# EasyEDA Pro project travellium-12v-desktop-power-supply-cc8d8467.epro, schematic EG1163S_P
Board Name: EG1163S_P; Create Date: 2024-08-01; Page Name: EG1163S_P_SCH; Project Name: 12V 30A 360W桌面DCDC电源; Schematic Name: EG1163S_P; Update Date: 2024-08-08; Company: 嘉立创EDA; Page Size: A4; Version: V1.0
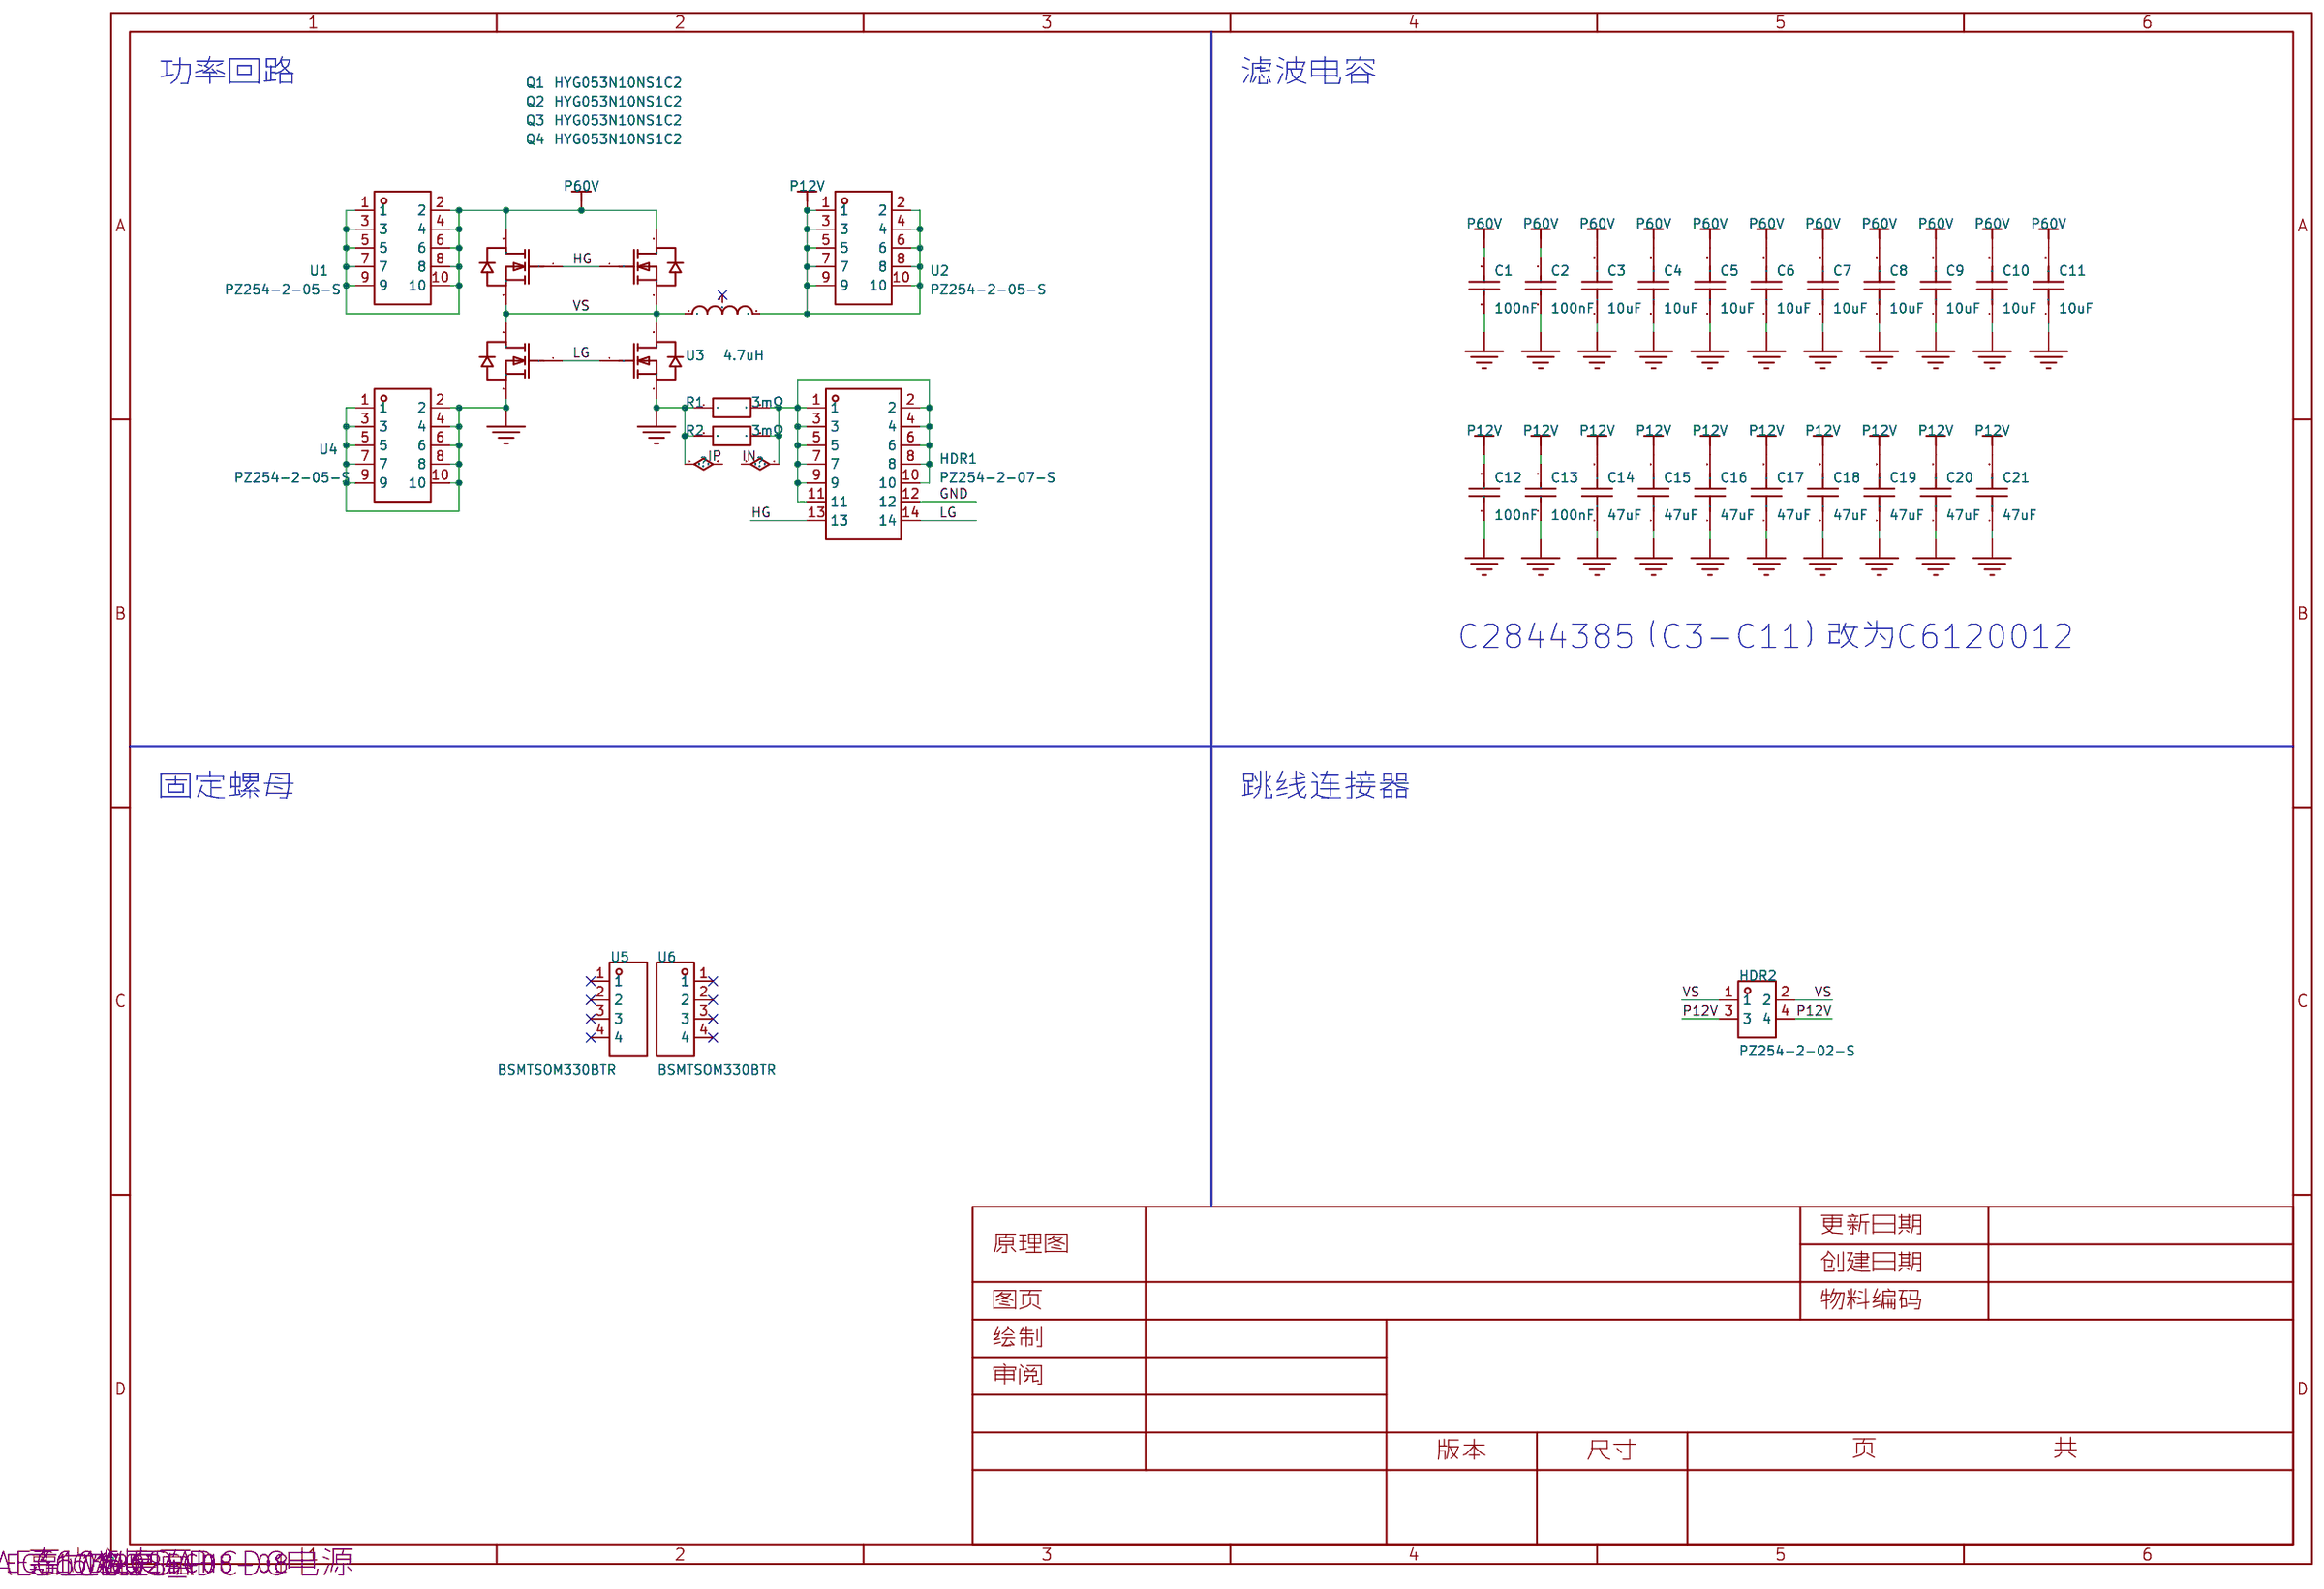
[diagram p2: schematic sheet]

## Parts
C1  100nF  [C1206]
C2  100nF  [C1206]
C3  10uF  [C1210]
C4  10uF  [C1210]
C5  10uF  [C1210]
C6  10uF  [C1210]
C7  10uF  [C1210]
C8  10uF  [C1210]
C9  10uF  [C1210]
C10  10uF  [C1210]
C11  10uF  [C1210]
C12  100nF  [C1206]
C13  100nF  [C1206]
C14  47uF  [C1206]
C15  47uF  [C1206]
C16  47uF  [C1206]
C17  47uF  [C1206]
C18  47uF  [C1206]
C19  47uF  [C1206]
C20  47uF  [C1206]
C21  47uF  [C1206]
HDR1  PZ254-2-07-S  [HDR-SMD_14P-P2.54-V-M-R2-C7-LS7.4]
HDR2  PZ254-2-02-S  [HDR-SMD_4P-P2.54-V-M-R2-C2-LS7.5]
Q1  HYG053N10NS1C2  [PDFN-8_L5.8-W5.0-P1.27-LS6.2-BL]
Q2  HYG053N10NS1C2  [PDFN-8_L5.8-W5.0-P1.27-LS6.2-BL]
Q3  HYG053N10NS1C2  [PDFN-8_L5.8-W5.0-P1.27-LS6.2-BL]
Q4  HYG053N10NS1C2  [PDFN-8_L5.8-W5.0-P1.27-LS6.2-BL]
R1  3mΩ  [R2512]
R2  3mΩ  [R2512]
U1  PZ254-2-05-S  [HDR-SMD_10P-P2.54-V-M-R2-C5-LS7.5]
U2  PZ254-2-05-S  [HDR-SMD_10P-P2.54-V-M-R2-C5-LS7.5]
U3  4.7uH  [IND-SMD_3P-L27.9-W19.7-P10.43-LS27.9-BL]
U4  PZ254-2-05-S  [HDR-SMD_10P-P2.54-V-M-R2-C5-LS7.5]
U5  BSMTSOM330BTR  [SMD_BD5.6-D4.1]
U6  BSMTSOM330BTR  [SMD_BD5.6-D4.1]

## Library data of the parts
C1 C2 C12 C13 = 1206B104K101NT: 容值:100nF;精度:±10%;额定电压:100V;材质(温度系数):X7R;; LCSC Part Name: 100nF ±10% 100V; Supplier Part: C110255; Manufacturer: FH(风华); Supplier Footprint: 1206; Datasheet: https://atta.szlcsc.com/upload/public/pdf/source/20200305/C486355_26A10D38EF8C2A5C37091D0039909270.pdf; Supplier: LCSC; Tolerance: ±10%; Voltage Rated: 100V; Temperature Coefficient: X7R
C3-C11 = C1210X7R106K101NT: 容值:10uF;精度:±10%;额定电压:100V;材质(温度系数):-;; LCSC Part Name: 10uF ±10% 100V; Supplier Part: C2844385; Manufacturer: SANYEAR(叁叶源); Supplier Footprint: 1210; Datasheet: https://atta.szlcsc.com/upload/public/pdf/source/20200102/C475251_1E30ECAC0E8AE7254982658A02A2D78C.pdf; Supplier: LCSC; Tolerance: ±10%; Voltage Rated: 100V
C14-C21 = CGA1210X5R106K630RT: 容值:47uF;精度:±20%;额定电压:25V;材质(温度系数):X5R;; Manufacturer: HRE(芯声); Supplier: LCSC; Supplier Part: C6120012; LCSC Part Name: 47uF ±20% 25V; Supplier Footprint: 1210; Tolerance: ±20%; Voltage Rated: 63V; Temperature Coefficient: X5R
HDR1 = PZ254-2-07-S: 插针结构:2x7P;间距:2.54mm;行距:2.54mm;圆针/方针:方针;安装类型:立贴;排数:双排;总PIN位数:14P;额定电流:3A;额定电压:250V;配合针长度:6mm;塑高:2.5mm;端接针长度:-;工作温度范围:-40℃~+105℃;焊接温度(最大值):260℃@5S;颜色:黑色;; LCSC Part Name: 2x7P 间距:2.54mm 方针 立贴 黑色; Supplier Part: C3294465; Manufacturer: HCTL(华灿天禄); Supplier Footprint: SMD,P=2.54mm; JLCPCB Part Class: 扩展库; Datasheet: https://atta.szlcsc.com/upload/public/pdf/source/20230609/FB2B5B924AA338E6CB93C3BD1D012B72.pdf; Supplier: LCSC; Pin Structure: 2x7P; Pitch: 2.54mm; Row Spacing: 2.54mm; Circluar Pins/Square Pins: 方针; Mounting Type: 立贴; Number of Rows: 双排; Number of Pins: 14P; Current Rating (Max): 3A; Voltage Rating (Max): 250V; Length of Mating Pin: 6mm; Insulation Height: 2.5mm; Operating Temperature Range: -40℃~+105℃; Soldering Temperature(Max): 260℃@5S; Color: 黑色
HDR2 = PZ254-2-02-S: 插针结构:2x2P;间距:2.54mm;行距:2.54mm;圆针/方针:方针;安装类型:立贴;排数:双排;总PIN位数:4P;额定电流:3A;额定电压:250V;配合针长度:6mm;塑高:2.5mm;端接针长度:-;工作温度范围:-40℃~+105℃;焊接温度(最大值):260℃@5S;颜色:黑色;; LCSC Part Name: 2x2P 间距:2.54mm 方针 立贴 黑色; Supplier Part: C3294460; Manufacturer: HCTL(华灿天禄); Supplier Footprint: SMD,P=2.54mm; Datasheet: https://atta.szlcsc.com/upload/public/pdf/source/20230609/FB2B5B924AA338E6CB93C3BD1D012B72.pdf; Supplier: LCSC; Pin Structure: 2x2P; Pitch: 2.54mm; Row Spacing: 2.54mm; Circluar Pins/Square Pins: 方针; Mounting Type: 立贴; Number of Rows: 双排; Number of Pins: 4P; Current Rating (Max): 3A; Voltage Rating (Max): 250V; Length of Mating Pin: 6mm; Insulation Height: 2.5mm; Operating Temperature Range: -40℃~+105℃; Soldering Temperature(Max): 260℃@5S; Color: 黑色
Q1-Q4 = HYG053N10NS1C2: 类型:N沟道;漏源电压(Vdss):100V;连续漏极电流(Id):95A;功率(Pd):83.3W;导通电阻(RDS(on)@Vgs,Id):4.6mΩ@10V,20A;阈值电压(Vgs(th)@Id):3V@250uA;; LCSC Part Name: N沟道 耐压:100V 电流:95A; Supplier Part: C2986239; Manufacturer: HUAYI(华羿微); Supplier Footprint: PDFN-8(5x5.8); Datasheet: https://atta.szlcsc.com/upload/public/pdf/source/20220330/BC0DD90DBB312B6AF0309CF1F3408B77.pdf; Supplier: LCSC; Type: N沟道; Drain Source Voltage (Vdss): 100V; Continuous Drain Current (Id): 95A; Power Dissipation (Pd): 83.3W; Drain Source On Resistance (RDS(on)@Vgs,Id): 4.6mΩ@10V,20A; Gate Threshold Voltage (Vgs(th)@Id): 3V@250uA; Total Gate Charge (Qg@Vgs): 73nC@10V; Input Capacitance (Ciss@Vds): 3.744nF@25V; Reverse Transfer Capacitance (Crss@Vds): 153pF@25V; Operating Temperature: -55℃~+175℃@(Tj)
R1 R2 = LR2512D-3W-3mR-1%: 电阻类型:采样电阻;阻值:3mΩ;精度:±1%;功率:3W;温度系数:25ppm/℃~+50ppm/℃;安装方式:贴片;; LCSC Part Name: 3mΩ ±1% 3W; Supplier Part: C500737; Manufacturer: Milliohm(毫欧); Supplier Footprint: 2512; Datasheet: https://atta.szlcsc.com/upload/public/pdf/source/20211008/27BCB003066C6550DC06C87D8395239C.pdf; Supplier: LCSC; Type: 采样电阻; Tolerance: ±1%; Power(Watts): 3W; Temperature Coefficient: 25ppm/℃~+50ppm/℃; Mounting Sytle: 贴片
U1 U2 U4 = PZ254-2-05-S: 插针结构:2x5P;间距:2.54mm;行距:2.54mm;圆针/方针:方针;安装类型:立贴;排数:双排;总PIN位数:10P;额定电流:3A;额定电压:250V;配合针长度:6mm;塑高:2.5mm;端接针长度:-;工作温度范围:-40℃~+105℃;焊接温度(最大值):260℃@5S;颜色:黑色;; LCSC Part Name: 2x5P 间距:2.54mm 方针 立贴 黑色; Supplier Part: C3294463; Manufacturer: HCTL(华灿天禄); Supplier Footprint: SMD,P=2.54mm; Datasheet: https://atta.szlcsc.com/upload/public/pdf/source/20230609/FB2B5B924AA338E6CB93C3BD1D012B72.pdf; Supplier: LCSC; Pin Structure: 2x5P; Pitch: 2.54mm; Row Spacing: 2.54mm; Circluar Pins/Square Pins: 方针; Mounting Type: 立贴; Number of Rows: 双排; Number of Pins: 10P; Current Rating (Max): 3A; Voltage Rating (Max): 250V; Length of Mating Pin: 6mm; Insulation Height: 2.5mm; Operating Temperature Range: -40℃~+105℃; Soldering Temperature(Max): 260℃@5S; Color: 黑色
U3 = FC-SE2915-4R7M: 电感值:4.7uH;精度:±20%;额定电流:32A;饱和电流(Isat):50.1A;; Manufacturer: FC(方成); Supplier: LCSC; Supplier Part: C7466125; LCSC Part Name: 4.7uH ±20% 50.1A; Supplier Footprint: SMD; Datasheet: https://atta.szlcsc.com/upload/public/pdf/source/20230712/96DF22DB850A53D8EF9E65329083AA7B.pdf; Tolerance: ±20%; Rated Current: 32A; Saturation Current (Isat): 50.1A
U5 U6 = BSMTSOM330BTR: 圆螺母 公称直径:M3 螺距:0.5mm 整体厚度:453mm L3材料:铜表面处理:镀锡 铜镀锡; LCSC Part Name: M3螺母 3MM M3x5.56xL3+1.53 BSMTSOM330BTR 铜镀锡; Supplier Part: C20617225; Manufacturer: DGBZ(东莞博众); Datasheet: https://atta.szlcsc.com/upload/public/pdf/source/20240129/9302AE24E0C0BB9358D3C074F5529EEE.pdf; Supplier: LCSC; specifications: M3x3; surface treatment: 铜镀锡; Product Description: M3x5.56xL3+1.53; length: 3MM

## Nets
GND: C1.1 C2.1 C3.1 C4.1 C5.1 C6.1 C7.1 C8.1 C9.1 C10.1 C11.1 C12.1 C13.1 C14.1 C15.1 C16.1 C17.1 C18.1 C19.1 C20.1 C21.1 HDR1.12 Q3.1(S) Q4.1(S) R1.1 R2.1 U4.1 U4.2 U4.3 U4.4 U4.5 U4.6 U4.7 U4.8 U4.9 U4.10
P12V: C12.2 C13.2 C14.2 C15.2 C16.2 C17.2 C18.2 C19.2 C20.2 C21.2 HDR2.3 HDR2.4 U2.1 U2.2 U2.3 U2.4 U2.5 U2.6 U2.7 U2.8 U2.9 U2.10 U3.2
P60V: C1.2 C2.2 C3.2 C4.2 C5.2 C6.2 C7.2 C8.2 C9.2 C10.2 C11.2 Q1.5(D) Q2.5(D) U1.1 U1.2 U1.3 U1.4 U1.5 U1.6 U1.7 U1.8 U1.9 U1.10
HG: HDR1.13 Q1.4(G) Q2.4(G)
IN: HDR1.1 HDR1.2 HDR1.3 HDR1.4 HDR1.5 HDR1.6 HDR1.7 HDR1.8 HDR1.9 HDR1.10 HDR1.11 R1.2 R2.2
LG: HDR1.14 Q3.4(G) Q4.4(G)
VS: HDR2.1 HDR2.2 Q1.1(S) Q2.1(S) Q3.5(D) Q4.5(D) U3.1

Not connected (* = marked no-connect by the designer): U3 3(NC)*; U5 1* 2* 3* 4*; U6 1* 2* 3* 4*

## Notes on the sheet
- 功率回路
- 滤波电容
- C2844385（C3-C11）改为C6120012
- 固定螺母
- 跳线连接器
